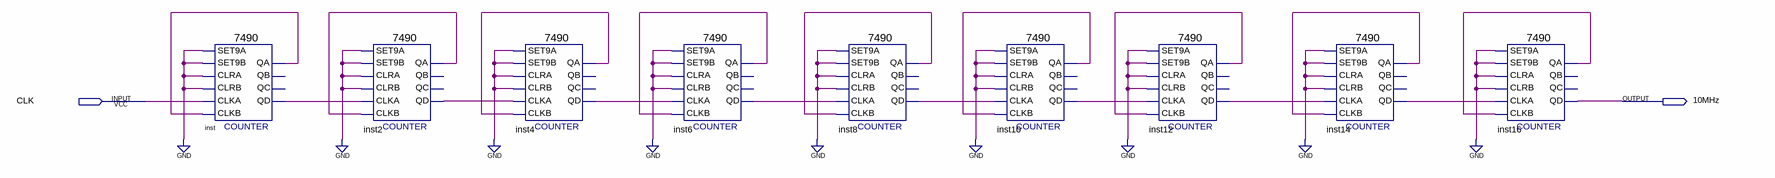
[diagram p0: schematic sheet]
// Quartus schematic FPGA_Mod10M.bdf as structural Verilog: 9 symbols, 2 pins
module FPGA_Mod10M (
  input  CLK,
  output \10MHz 
);

  wire inst2_qa, inst2_qd, inst4_qa, inst4_qd, inst6_qa, inst6_qd, inst8_qa, inst8_qd, inst10_qa, inst10_qd,
       inst12_qa, inst12_qd, inst14_qa, inst14_qd, inst16_qa, inst_qa, inst_qd;

  \7490  inst (
    .SET9A(1'b0), .CLRA(1'b0), .SET9B(1'b0), .CLKB(inst_qa), .CLKA(CLK), .CLRB(1'b0), .QD(inst_qd),
    .QA(inst_qa));  // open: QB, QC
  \7490  inst2 (
    .SET9A(1'b0), .CLRA(1'b0), .SET9B(1'b0), .CLKB(inst2_qa), .CLKA(inst_qd), .CLRB(1'b0), .QD(inst2_qd),
    .QA(inst2_qa));  // open: QB, QC
  \7490  inst4 (
    .SET9A(1'b0), .CLRA(1'b0), .SET9B(1'b0), .CLKB(inst4_qa), .CLKA(inst2_qd), .CLRB(1'b0), .QD(inst4_qd),
    .QA(inst4_qa));  // open: QB, QC
  \7490  inst6 (
    .SET9A(1'b0), .CLRA(1'b0), .SET9B(1'b0), .CLKB(inst6_qa), .CLKA(inst4_qd), .CLRB(1'b0), .QD(inst6_qd),
    .QA(inst6_qa));  // open: QB, QC
  \7490  inst8 (
    .SET9A(1'b0), .CLRA(1'b0), .SET9B(1'b0), .CLKB(inst8_qa), .CLKA(inst6_qd), .CLRB(1'b0), .QD(inst8_qd),
    .QA(inst8_qa));  // open: QB, QC
  \7490  inst10 (
    .SET9A(1'b0), .CLRA(1'b0), .SET9B(1'b0), .CLKB(inst10_qa), .CLKA(inst8_qd), .CLRB(1'b0), .QD(inst10_qd),
    .QA(inst10_qa));  // open: QB, QC
  \7490  inst12 (
    .SET9A(1'b0), .CLRA(1'b0), .SET9B(1'b0), .CLKB(inst12_qa), .CLKA(inst10_qd), .CLRB(1'b0), .QD(inst12_qd),
    .QA(inst12_qa));  // open: QB, QC
  \7490  inst14 (
    .SET9A(1'b0), .CLRA(1'b0), .SET9B(1'b0), .CLKB(inst14_qa), .CLKA(inst12_qd), .CLRB(1'b0), .QD(inst14_qd),
    .QA(inst14_qa));  // open: QB, QC
  \7490  inst16 (
    .SET9A(1'b0), .CLRA(1'b0), .SET9B(1'b0), .CLKB(inst16_qa), .CLKA(inst14_qd), .CLRB(1'b0), .QD(\10MHz ),
    .QA(inst16_qa));  // open: QB, QC
endmodule
